# Altium schematic sheet 100_AC_DC.SchDoc: ETAPA AC_DC
size A4; Date: 23/10/2026; DrawnBy: Santiago Londoño; SheetNumber: 1; SheetTotal: 8
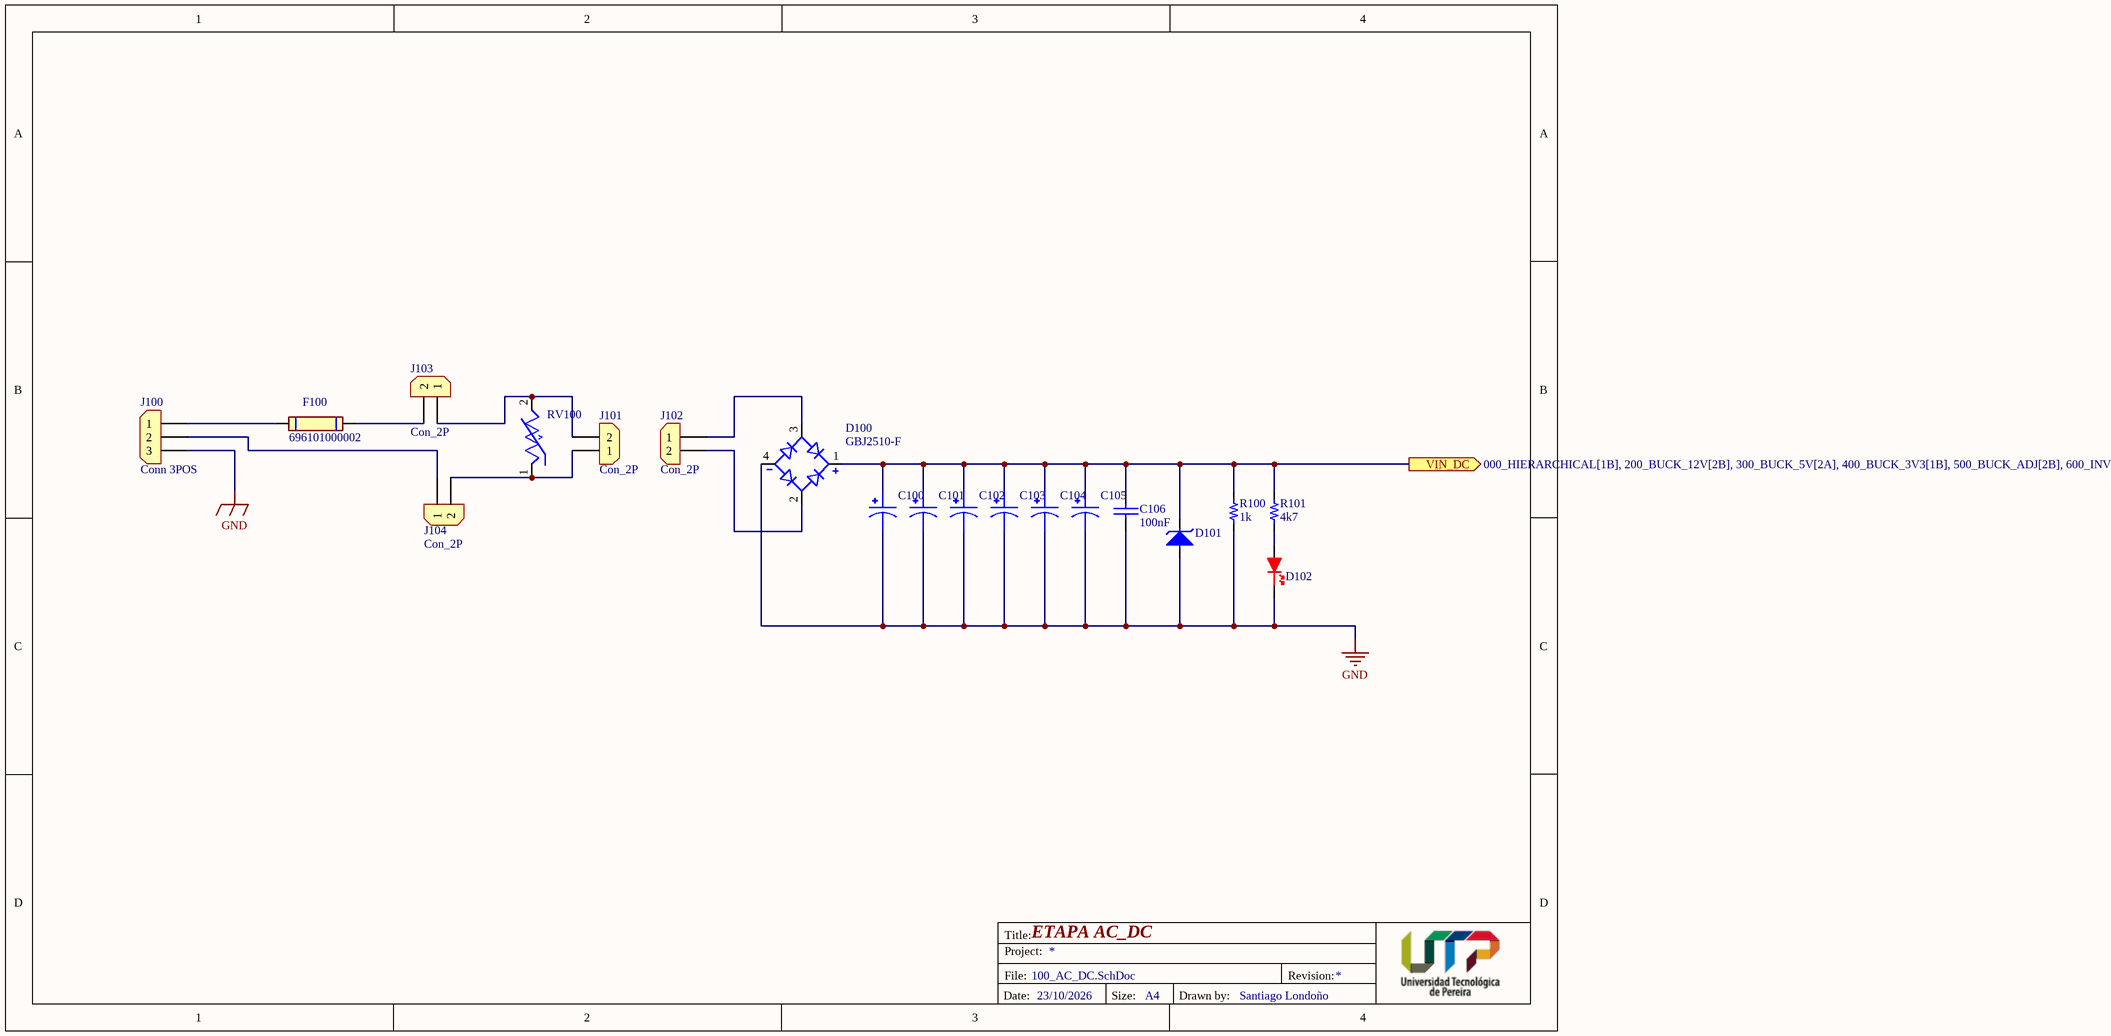
[diagram p0: 100_AC_DC.SchDoc]

## Parts
C100  MAL225638472E3  [CAP_MAL225638472E3]  (value not drawn)
C101  MAL225638472E3  [CAP_MAL225638472E3]  (value not drawn)
C102  MAL225638472E3  [CAP_MAL225638472E3]  (value not drawn)
C103  MAL225638472E3  [CAP_MAL225638472E3]  (value not drawn)
C104  MAL225638472E3  [CAP_MAL225638472E3]  (value not drawn)
C105  MAL225638472E3  [CAP_MAL225638472E3]  (value not drawn)
C106  value 100nF  [1206]  (hidden comment: 100nF 100V)
D100  GBJ2510-F  [DIOB_GBJ2510-F]
D101  38.9V  10.3A  [DO_214AC]  (value not drawn)
D102  LED  [LED_5MM]  (value not drawn)
F100  696101000002  [696101000002]
J100  Conn 3POS  [CON_3x1_TH_5mm]
J101  Con_2P  [CON_2x1_TH_3.5mm_TB]
J102  Con_2P  [CON_2x1_TH_3.5mm_TB]
J103  Con_2P  [CON_2x1_TH_3.5mm_TB]
J104  Con_2P  [CON_2x1_TH_3.5mm_TB]
R100  value 1k  [0201]  (hidden comment: 1k 1/20W)
R101  value 4k7  [0402]  (hidden comment: 4k7 1/16W)
RV100  (no value)  [VAR_B72220S0301K101]

## Ports
VIN_DC (out, see 000_HIERARCHICAL[1B], 200_BUCK_12V[2B], 300_BUCK_5V[2A], 400_BUCK_3V3[1B], 500_BUCK_ADJ[2B], 600_INV_N12V[2B])

## Nets
GND: C100.2 C101.2 C102.2 C103.2 C104.2 C105.2 C106.2 D100.4(NEG) D101.2 D102.K J100.3 R100.1
VIN_DC: C100.1 C101.1 C102.1 C103.1 C104.1 C105.1 C106.1 D100.1(POS) D101.1 R100.2 R101.2 ; port VIN_DC
NetD100_2: D100.2(AC1) J102.2
NetD100_3: D100.3(AC2) J102.1
NetD102_A: D102.A R101.1
NetF100_1: F100.1 J100.1
NetF100_2: F100.2 J103.2
NetJ100_2: J100.2 J104.1
NetJ101_1: J101.1 J104.2 RV100.1
NetJ101_2: J101.2 J103.1 RV100.2

## Notes on the sheet
- Title:
- Project:
- File:
- Revision:
- Date:
- Size:
- A4
- Drawn by:

## Library data of the parts
C106 = Cap_0.1uF_1206_100V: CAP CER 0.1UF 100V X7R 1206; Manufacturer: Samsung Electro-Mechanics; Manufacturer Part Number: CL31B104KCFNNNE; Supplier 1: Digi-Key; Supplier Part Number 1: 1276-1151-1-ND; Last modified by: J.Jaramillo; Last modified date: 20240309; ComponentLink1Description: Digi-Key; ComponentLink1URL: https://www.digikey.com/en/products/detail/samsung-electro-mechanics/CL31B104KCFNNNE/3886809
D100 = GBJ2510-F: Bridge Rectifier Single Phase Standard 1 kV Through Hole GBJ; MF: Diodes Inc.; Package: SIP-4 Diodes Incorporated; Purchase-URL: https://pricing.snapeda.com/search/part/GBJ2510-F/?ref=eda; SnapEDA_Link: https://www.snapeda.com/parts/GBJ2510-F/Diodes+Inc./view-part/?ref=snap; MP: GBJ2510-F; Check_prices: https://www.snapeda.com/parts/GBJ2510-F/Diodes+Inc./view-part/?ref=eda; Digi-Key_Part_Number: GBJ2510-FDI-ND; Value: *
D101 = TVS_38.9V_1CH_DO_214AC: TVS DIODE 24VWM 38.9VC SMA; Manufacturer: Bourns Inc.; Manufacturer Part Number: SMAJ24CA; Supplier 1: Digi-Key; Supplier Part Number 1: SMAJ24CABCT-ND; Reel Sotck: N/A; Last modified by: J.Jaramillo; Last modified date: 20220603; ComponentLink1Description: Digi-Key; ComponentLink1URL: https://www.digikey.com/en/products/detail/bourns-inc/SMAJ24CA/2254533
D102 = LED_5MM_GENERIC_THT: 5mm LED Generic THT
F100 = 696101000002: MF: {'manufacturer': u'W\xfcrth Elektronik'}; Package: None; Price: None; Value: *; MP: 696101000002; Availability: Unavailable
J100 = Con_3x1_TH_5.0mm: TERM BLK 3POS SIDE ENTRY 5MM PCB; Manufacturer: Phoenix Contact; Manufacturer Part Number: 1935174; Supplier 1: Digi-Key; Supplier Part Number 1: 277-1578-ND; Reel Stock: N/A; Last modified by: J.Jaramillo; Last modified date: 20240310; ComponentLink1Description: Digi-Key; ComponentLink1URL: https://www.digikey.com/product-detail/en/phoenix-contact/1935174/277-1578-ND/568615
J101-J104 = Con_2x1_TH_3.5mm: TERM BLK 2POS SIDE ENT 3.5MM PCB; Manufacturer: Würth Elektronik; Manufacturer Part Number: 691214110002; Supplier 1: Digi-Key; Supplier Part Number 1: 732-2747-ND; Last modified by: J.Jaramillo; Last modified date: 20240310; ComponentLink1Description: Digi-key; ComponentLink1URL: https://www.digikey.com/product-detail/en/wurth-electronics-inc/691214110002/732-2747-ND/2508516; Reel Stock: N/A
R100 = Res_1k_0201_1/20W: RES 1K OHM 1% 1/20W 0201; Manufacturer: YAGEO; Manufacturer Part Number: RC0201FR-071KL; Supplier 1: Digi-Key; Supplier Part Number 1: 311-1KMCT-ND; Reel Stock: N/A; Last modified by: J.Jaramillo; Last modified date: 20240310; ComponentLink1Description: Digi-Key; ComponentLink1URL: https://www.digikey.com/en/products/detail/yageo/RC0201FR-071KL/3202389?s=N4IgTCBcDaIMwEYEFoEGkCyBhAKsgcgCIgC6AvkA
R101 = Res_4k7_0402_1/16W: RES SMD 4.7K OHM 5% 1/16W 0402; Manufacturer: Yageo; Manufacturer Part Number: RC0402JR-074K7L; Supplier 1: Digi-Key; Supplier Part Number 1: 311-4.7KJRCT-ND; Reel Stock: N/A; Last modified by: J.Jaramillo; Last modified date: 20240310; ComponentLink1Description: Digi-Key; ComponentLink1URL: https://www.digikey.com/product-detail/en/yageo/RC0402JR-074K7L/311-4-7KJRCT-ND/729424
RV100 = B72220S0301K101: Varistor: metal-oxide; THT; 300VAC; 385VDC; 470V; 8000A; 173J; MF: EPCOS; SnapEDA_Link: https://www.snapeda.com/parts/B72220S0301K101/EPCOS/view-part/?ref=snap; Package: Disc-20 EPCOS - TDK Electronics; Value: *; MP: B72220S0301K101; Check_prices: https://www.snapeda.com/parts/B72220S0301K101/EPCOS/view-part/?ref=eda
C100-C105 = MAL225638472E3: Package: None; Price: None; Value: *; MP: MAL225638472E3; Availability: Unavailable